# Altium schematic sheet Top_Sheet.SchDoc
size A4; DocumentNumber: 1; SheetNumber: 1; SheetTotal: 6
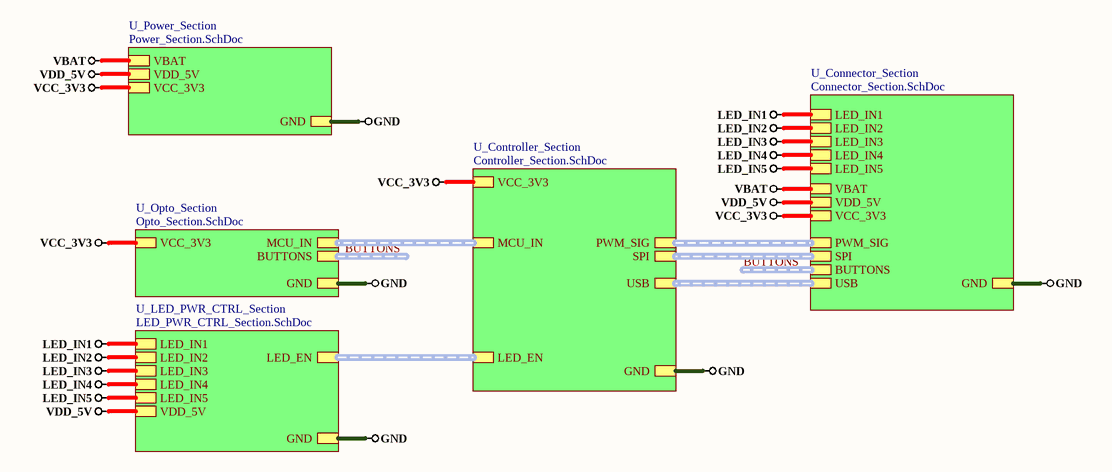
[diagram p0: Top_Sheet.SchDoc]

## Sub-sheets
U_Connector_Section = Connector_Section.SchDoc: PWM_SIG (harness PWM_SIG), BUTTONS (harness BUTTONS), VBAT, VDD_5V, VCC_3V3, USB (harness USB), LED_IN1, LED_IN2, LED_IN3, LED_IN4, LED_IN5, GND, SPI (harness SPI)
U_Controller_Section = Controller_Section.SchDoc: PWM_SIG (harness PWM_SIG), MCU_IN (harness MCU_IN), VCC_3V3, LED_EN (harness LED_EN), USB (harness USB), GND, SPI (harness SPI)
U_LED_PWR_CTRL_Section = LED_PWR_CTRL_Section.SchDoc: LED_EN (harness LED_EN), LED_IN1, LED_IN2, LED_IN3, GND, LED_IN4, LED_IN5, VDD_5V
U_Opto_Section = Opto_Section.SchDoc: BUTTONS (harness BUTTONS), MCU_IN (harness MCU_IN), VCC_3V3, GND
U_Power_Section = Power_Section.SchDoc: VBAT, VDD_5V, VCC_3V3, GND

## Nets
GND: sheet U_Connector_Section/GND, sheet U_Power_Section/GND, sheet U_Opto_Section/GND, sheet U_Controller_Section/GND, sheet U_LED_PWR_CTRL_Section/GND
LED_IN1: sheet U_Connector_Section/LED_IN1, sheet U_LED_PWR_CTRL_Section/LED_IN1
LED_IN2: sheet U_Connector_Section/LED_IN2, sheet U_LED_PWR_CTRL_Section/LED_IN2
LED_IN3: sheet U_Connector_Section/LED_IN3, sheet U_LED_PWR_CTRL_Section/LED_IN3
LED_IN4: sheet U_Connector_Section/LED_IN4, sheet U_LED_PWR_CTRL_Section/LED_IN4
LED_IN5: sheet U_Connector_Section/LED_IN5, sheet U_LED_PWR_CTRL_Section/LED_IN5
VBAT: sheet U_Connector_Section/VBAT, sheet U_Power_Section/VBAT
VCC_3V3: sheet U_Connector_Section/VCC_3V3, sheet U_Power_Section/VCC_3V3, sheet U_Opto_Section/VCC_3V3, sheet U_Controller_Section/VCC_3V3
VDD_5V: sheet U_Connector_Section/VDD_5V, sheet U_Power_Section/VDD_5V, sheet U_LED_PWR_CTRL_Section/VDD_5V

## Buses and harness runs
harness BUTTONS = sheet U_Connector_Section/BUTTONS
harness BUTTONS = sheet U_Opto_Section/BUTTONS
harness sheet U_Connector_Section/PWM_SIG = sheet U_Controller_Section/PWM_SIG
harness sheet U_Connector_Section/SPI = sheet U_Controller_Section/SPI
harness sheet U_Connector_Section/USB = sheet U_Controller_Section/USB
harness sheet U_Controller_Section/LED_EN = sheet U_LED_PWR_CTRL_Section/LED_EN
harness sheet U_Controller_Section/MCU_IN = sheet U_Opto_Section/MCU_IN